# Altium schematic sheet bms1_bms.schdoc
size 289 x 200 mm; Name: default297x210; Symbol: default297x210; Device: default297x210; Size: "A4"; Id: /; File: bms; Sheet: /; SheetNumber: 13; SheetTotal: 17
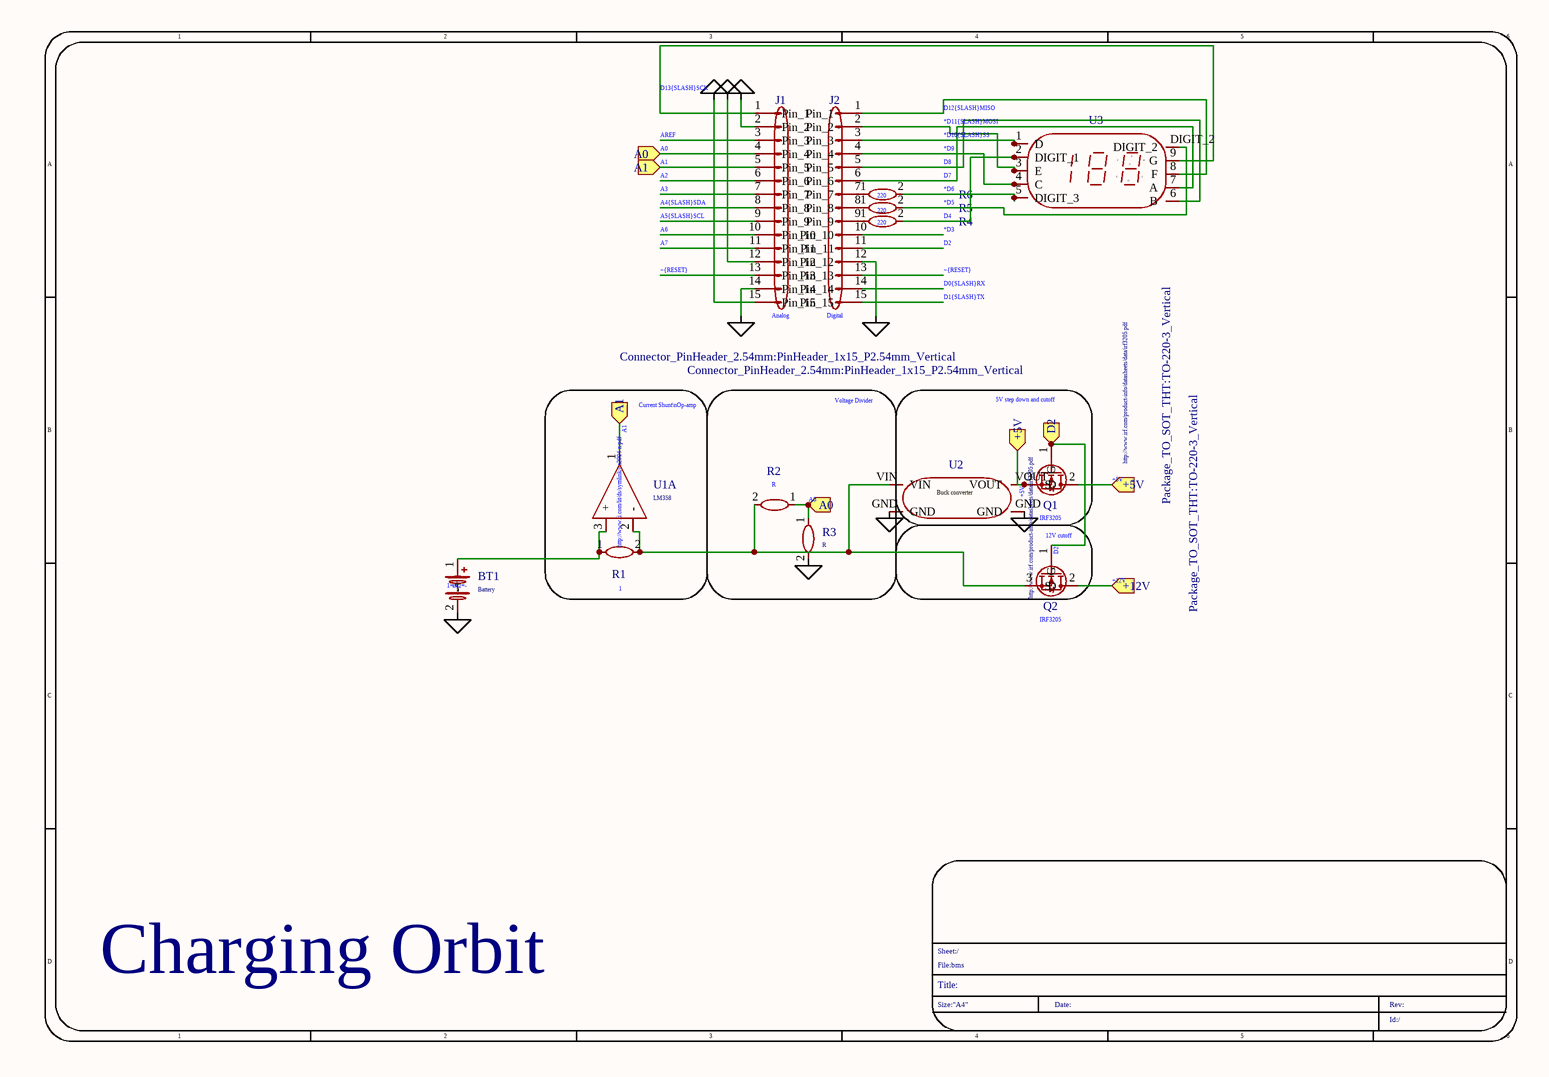
[diagram p0: bms1_bms.schdoc]

## Parts
BT1  value Battery  Sim.Device: V  Sim.Type: DC  Sim.Pins: 1=+ 2=-  (hidden comment: Device_Battery)
J1  value Analog  Origin Footprint: Connector_PinHeader_2.54mm:PinHeader_1x15_P2.54mm_Vertical  (hidden comment: Connector_Generic_Conn_01x15)
J2  value Digital  Origin Footprint: Connector_PinHeader_2.54mm:PinHeader_1x15_P2.54mm_Vertical  (hidden comment: Connector_Generic_Conn_01x15)
Q1  value IRF3205  Origin Footprint: Package_TO_SOT_THT:TO-220-3_Vertical  (hidden comment: Transistor_FET_IRF3205)
Q2  value IRF3205  Origin Footprint: Package_TO_SOT_THT:TO-220-3_Vertical  (hidden comment: Transistor_FET_IRF3205)
R1  value 1  (hidden comment: Device_R)
R2  value R  (hidden comment: Device_R)
R3  value R  (hidden comment: Device_R)
R4  value 220  (hidden comment: Device_R)
R5  value 220  (hidden comment: Device_R)
R6  value 220  (hidden comment: Device_R)
U1  value LM358  (hidden comment: Amplifier_Operational_LM358)  (part A of 3)
U2  buckconverter_buckconv  (value not drawn)
U3  New_Library_1led_E30401  (value not drawn)

## Blocks framed on the sheet
Current Shunt\nOp-amp: R1 U1
Voltage Divider: R2 R3
5V step down and cutoff: Q1 U2
12V cutoff: Q2

## Ports
+5V (in), +12V (in), A0 (in), A1 (in), D2 (in)

## Nets
POWER_+3.3V: J1.2(Pin_2)
POWER_+5V: J1.12(Pin_12)
POWER_GND: BT1.2(-) J1.14(Pin_14) J2.12(Pin_12) R3.2 U2.GND
POWER_VCC: J1.15(Pin_15)
*D3: J2.10(Pin_10)
*D5: R5.2 U3.DIGIT_2
*D6: R6.2 U3.5(DIGIT_3)
*D9: J2.4(Pin_4) U3.4(C)
*D10{SLASH}SS: J2.3(Pin_3) U3.1(D)
*D11{SLASH}MOSI: J2.2(Pin_2) U3.3(E)
+5V: Q1.2(D) Q1.3(S) U2.VOUT ; port +5V
+12V: Q2.2(D) ; port +12V
A0: J1.4(Pin_4) R2.1 R3.1 ; port A0
A1: J1.5(Pin_5) U1.1 ; port A1
A2: J1.6(Pin_6)
A3: J1.7(Pin_7)
A4{SLASH}SDA: J1.8(Pin_8)
A5{SLASH}SCL: J1.9(Pin_9)
A6: J1.10(Pin_10)
A7: J1.11(Pin_11)
AREF: J1.3(Pin_3)
D0{SLASH}RX: J2.14(Pin_14)
D1{SLASH}TX: J2.15(Pin_15)
D2: J2.11(Pin_11) Q1.1(G) Q2.1(G) ; port D2
D4: R4.2 U3.2(DIGIT_1)
D7: J2.6(Pin_6) U3.7(A)
D8: J2.5(Pin_5) U3.6(B)
D12{SLASH}MISO: J2.1(Pin_1) U3.8(F)
D13{SLASH}SCK: J1.1(Pin_1) U3.9(G)
~{RESET}: J1.13(Pin_13) J2.13(Pin_13)
NetBT1_1: BT1.1(+) R1.1 U1.3(+)
NetJ2_7: J2.7(Pin_7) R6.1
NetJ2_8: J2.8(Pin_8) R5.1
NetJ2_9: J2.9(Pin_9) R4.1
NetQ2_3: Q2.3(S) R1.2 R2.2 U1.2(-) U2.VIN

## Notes on the sheet
- Charging Orbit
- 1
- 2
- 3
- 4
- 5
- 6
- A
- B
- C
- D
- File:bms
- Sheet:/
- Size:"A4"
- Title:
- Date:
- Rev:
- Id:/
- (in symbol buckconverter_buckconv) Buck converter

## Library data of the parts
BT1 = Device_Battery: Add into BOM: yes; Symbol: Device_Battery; Device: Device_Battery; Sim_Device: V; Sim_Type: DC; Sim_Pins: 1=+ 2=-; Convert to PCB: yes
J1 J2 = Connector_Generic_Conn_01x15: Add into BOM: yes; Symbol: Connector_Generic_Conn_01x15; Device: Connector_Generic_Conn_01x15; Convert to PCB: yes
Q1 Q2 = Transistor_FET_IRF3205: Add into BOM: yes; Symbol: Transistor_FET_IRF3205; Device: Transistor_FET_IRF3205; User doc link: http://www.irf.com/product-info/datasheets/data/irf3205.pdf; Convert to PCB: yes
R1-R6 = Device_R: Add into BOM: yes; Symbol: Device_R; Device: Device_R; Convert to PCB: yes
U1 = Amplifier_Operational_LM358: Add into BOM: yes; Symbol: Amplifier_Operational_LM358; Device: Amplifier_Operational_LM358; User doc link: http://www.ti.com/lit/ds/symlink/lm2904-n.pdf; Convert to PCB: yes
U2 = buckconverter_buckconv: Add into BOM: yes; Symbol: buckconverter_buckconv; Device: buckconverter_buckconv; Convert to PCB: yes
U3 = New_Library_1led_E30401: Add into BOM: yes; Symbol: New_Library_1led_E30401; Device: New_Library_1led_E30401; Convert to PCB: yes